# Altium schematic sheet Y.SchDoc
size A4
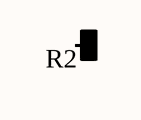
[diagram p0: Y.SchDoc]

## Parts
R2  (no value)

## Ports
P

## Nets
P: R2.1(A) ; port P

## Library data of the parts
R2 = RES